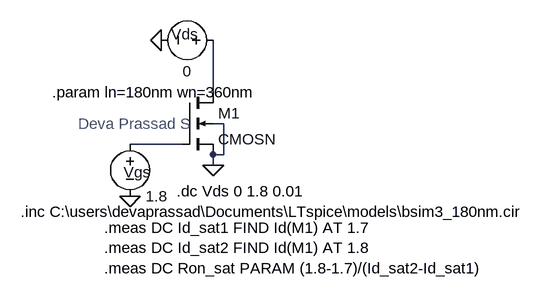
[diagram p0: schematic ron_saturated.asc]
ron_saturated.asc, the LTspice schematic file:
Version 4.1
SHEET 1 880 680
WIRE 176 128 176 48
WIRE 192 176 176 176
WIRE 128 208 48 208
WIRE 192 224 192 176
WIRE 192 224 176 224
WIRE 176 240 176 224
FLAG 176 240 0
FLAG 96 48 0
FLAG 48 288 0
SYMBOL nmos4 128 128 R0
SYMATTR InstName M1
SYMATTR Value2 l={ln} w={wn} ad={ln*wn} as={ln*wn} pd={2*ln+wn} ps={2*ln+wn}
SYMATTR Value CMOSN
SYMBOL voltage 48 192 R0
WINDOW 0 -10 59 Left 2
WINDOW 123 0 0 Left 0
WINDOW 39 0 0 Left 0
SYMATTR InstName Vgs
SYMATTR Value 1.8
SYMBOL voltage 192 48 R90
WINDOW 0 6 60 VBottom 2
WINDOW 3 32 56 VTop 2
WINDOW 123 0 0 Left 0
WINDOW 39 0 0 Left 0
SYMATTR InstName Vds
SYMATTR Value 0
TEXT 120 280 Left 2 !.dc Vds 0 1.8 0.01
TEXT -120 312 Left 2 !.inc C:\\users\\devaprassad\\Documents\\LTspice\\models\\bsim3_180nm.cir
TEXT -72 128 Left 2 !.param ln=180nm wn=360nm
TEXT 8 336 Left 2 !.meas DC Id_sat1 FIND Id(M1) AT 1.7\n.meas DC Id_sat2 FIND Id(M1) AT 1.8\n.meas DC Ron_sat PARAM (1.8-1.7)/(Id_sat2-Id_sat1)
TEXT -32 176 Left 2 ;Deva Prassad S

The netlist it stands for:
* ron_saturated.asc
M1 N001 N002 0 0 CMOSN l={ln} w={wn} ad={ln*wn} as={ln*wn} pd={2*ln+wn} ps={2*ln+wn}
Vgs N002 0 1.8
Vds N001 0 0
.model NMOS NMOS
.model PMOS PMOS
.lib standard.mos
.dc Vds 0 1.8 0.01
.inc C:\users\devaprassad\Documents\LTspice\models\bsim3_180nm.cir
.param ln=180nm wn=360nm
.meas DC Id_sat1 FIND Id(M1) AT 1.7
.meas DC Id_sat2 FIND Id(M1) AT 1.8
.meas DC Ron_sat PARAM (1.8-1.7)/(Id_sat2-Id_sat1)
* Deva Prassad S
.backanno
.end